# Altium schematic sheet Top_Sheet.SchDoc
size 420 x 297 mm; SheetNumber: 1; SheetTotal: 6
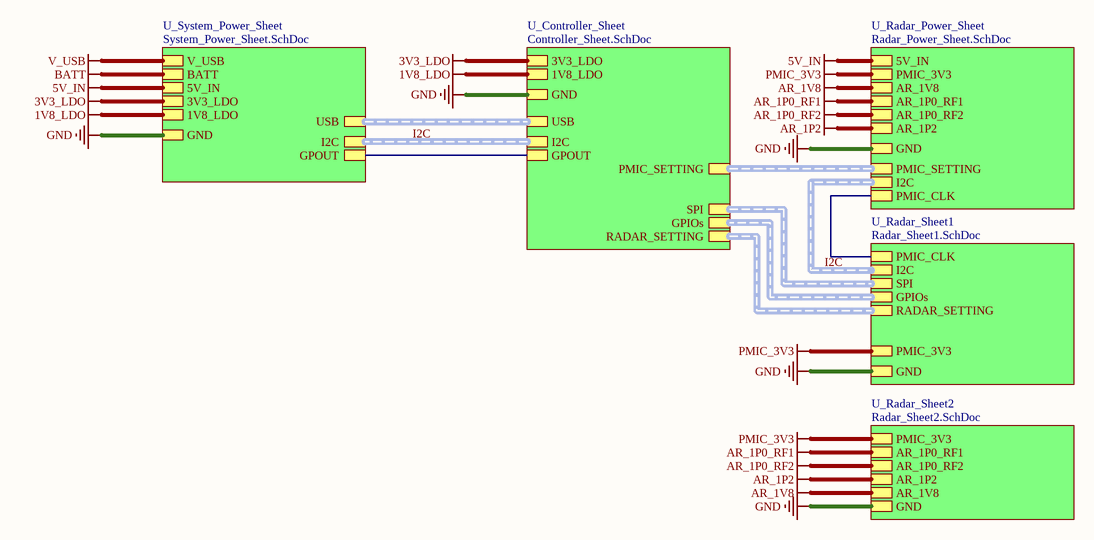
[diagram p0: Top_Sheet.SchDoc]

## Sub-sheets
U_Controller_Sheet = Controller_Sheet.SchDoc: USB (harness USB), GND, 3V3_LDO, 1V8_LDO, GPIOs (harness GPIOs), SPI (harness SPI), PMIC_SETTING (harness PMIC_SETTING), GPOUT, RADAR_SETTING (harness RADAR_SETTING), I2C (harness I2C)
U_Radar_Power_Sheet = Radar_Power_Sheet.SchDoc: I2C (harness I2C), GND, 5V_IN, AR_1P0_RF1, PMIC_3V3, AR_1P2, AR_1P0_RF2, AR_1V8, PMIC_SETTING (harness PMIC_SETTING), PMIC_CLK
U_Radar_Sheet1 = Radar_Sheet1.SchDoc: GPIOs (harness GPIOs), I2C (harness I2C), SPI (harness SPI), PMIC_3V3, GND, PMIC_CLK, RADAR_SETTING (harness RADAR_SETTING)
U_Radar_Sheet2 = Radar_Sheet2.SchDoc: GND, AR_1P0_RF1, PMIC_3V3, AR_1P2, AR_1P0_RF2, AR_1V8
U_System_Power_Sheet = System_Power_Sheet.SchDoc: USB (harness USB), I2C (harness I2C), GND, BATT, V_USB, 3V3_LDO, 5V_IN, 1V8_LDO, GPOUT

## Nets
1V8_LDO: sheet U_System_Power_Sheet/1V8_LDO, sheet U_Controller_Sheet/1V8_LDO
3V3_LDO: sheet U_System_Power_Sheet/3V3_LDO, sheet U_Controller_Sheet/3V3_LDO
5V_IN: sheet U_Radar_Power_Sheet/5V_IN, sheet U_System_Power_Sheet/5V_IN
AR_1P0_RF1: sheet U_Radar_Power_Sheet/AR_1P0_RF1, sheet U_Radar_Sheet2/AR_1P0_RF1
AR_1P0_RF2: sheet U_Radar_Power_Sheet/AR_1P0_RF2, sheet U_Radar_Sheet2/AR_1P0_RF2
AR_1P2: sheet U_Radar_Power_Sheet/AR_1P2, sheet U_Radar_Sheet2/AR_1P2
AR_1V8: sheet U_Radar_Power_Sheet/AR_1V8, sheet U_Radar_Sheet2/AR_1V8
BATT: sheet U_System_Power_Sheet/BATT
GND: sheet U_Radar_Power_Sheet/GND, sheet U_Radar_Sheet2/GND, sheet U_System_Power_Sheet/GND, sheet U_Controller_Sheet/GND, sheet U_Radar_Sheet1/GND
PMIC_3V3: sheet U_Radar_Power_Sheet/PMIC_3V3, sheet U_Radar_Sheet2/PMIC_3V3, sheet U_Radar_Sheet1/PMIC_3V3
V_USB: sheet U_System_Power_Sheet/V_USB
(unnamed): sheet U_Radar_Power_Sheet/PMIC_CLK, sheet U_Radar_Sheet1/PMIC_CLK
(unnamed): sheet U_System_Power_Sheet/GPOUT, sheet U_Controller_Sheet/GPOUT

## Buses and harness runs
harness I2C = sheet U_Controller_Sheet/I2C = sheet U_System_Power_Sheet/I2C
harness I2C = sheet U_Radar_Power_Sheet/I2C = sheet U_Radar_Sheet1/I2C
harness sheet U_Controller_Sheet/GPIOs = sheet U_Radar_Sheet1/GPIOs
harness sheet U_Controller_Sheet/PMIC_SETTING = sheet U_Radar_Power_Sheet/PMIC_SETTING
harness sheet U_Controller_Sheet/RADAR_SETTING = sheet U_Radar_Sheet1/RADAR_SETTING
harness sheet U_Controller_Sheet/SPI = sheet U_Radar_Sheet1/SPI
harness sheet U_Controller_Sheet/USB = sheet U_System_Power_Sheet/USB

## Notes on the sheet
- File:
- Title:
- Date:
- Page
- Num:
- Total:
- Drawn By: Huzaifa Ali